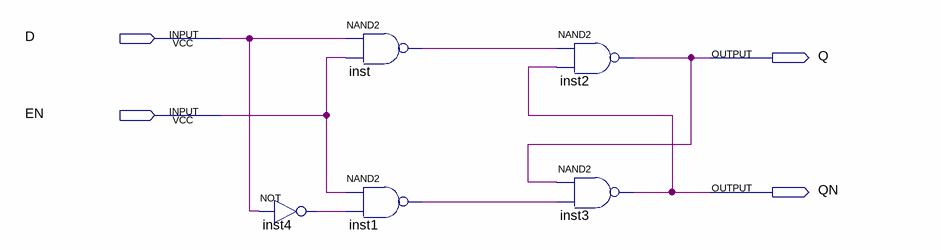
[diagram p0: schematic sheet]
// Quartus schematic d_latch_enable.bdf as structural Verilog: 5 symbols, 4 pins
module d_latch_enable (
  input  D,
  input  EN,
  output Q,
  output QN
);

  wire inst1_out, inst4_out, inst_out;

  not inst4 (inst4_out, D);
  nand inst (inst_out, D, EN);
  nand inst1 (inst1_out, EN, inst4_out);
  nand inst2 (Q, inst_out, QN);
  nand inst3 (QN, Q, inst1_out);
endmodule
